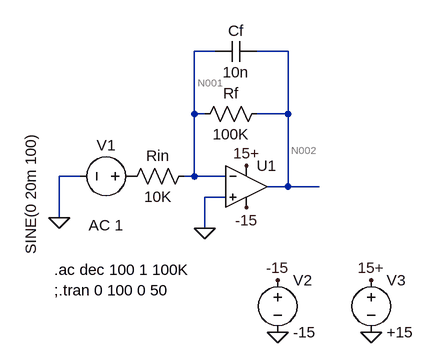
[diagram p0: schematic inverting_active_low-pass.asc]
inverting_active_low-pass.asc, the LTspice schematic file:
Version 4.1
SHEET 1 880 680
WIRE 192 16 160 16
WIRE 304 16 256 16
WIRE 160 112 160 16
WIRE 176 112 160 112
WIRE 304 112 304 16
WIRE 304 112 256 112
WIRE -16 208 -48 208
WIRE 160 208 160 112
WIRE 160 208 144 208
WIRE 208 208 160 208
WIRE 304 224 304 112
WIRE 304 224 272 224
WIRE 352 224 304 224
WIRE 208 240 176 240
WIRE -48 272 -48 208
WIRE 176 288 176 240
FLAG 176 288 0
FLAG -48 272 0
FLAG 288 448 0
FLAG 432 448 0
FLAG 432 368 15+
FLAG 288 368 -15
FLAG 240 256 -15
FLAG 240 192 15+
SYMBOL res 272 96 R90
WINDOW 0 0 56 VBottom 2
WINDOW 3 32 56 VTop 2
SYMATTR InstName Rf
SYMATTR Value 100K
SYMBOL res 160 192 R90
WINDOW 0 0 56 VBottom 2
WINDOW 3 32 56 VTop 2
SYMATTR InstName Rin
SYMATTR Value 10K
SYMBOL cap 256 0 R90
WINDOW 0 0 32 VBottom 2
WINDOW 3 32 32 VTop 2
SYMATTR InstName Cf
SYMATTR Value 10n
SYMBOL voltage 80 208 R90
WINDOW 0 -32 56 VBottom 2
WINDOW 3 27 156 Top 2
WINDOW 123 60 56 VTop 2
WINDOW 39 0 0 Left 0
SYMATTR InstName V1
SYMATTR Value SINE(0 20m 100)
SYMATTR Value2 AC 1
SYMBOL OpAmps\\UniversalOpAmp 240 224 R0
SYMATTR InstName U1
SYMBOL voltage 288 352 R0
WINDOW 123 0 0 Left 0
WINDOW 39 0 0 Left 0
SYMATTR InstName V2
SYMATTR Value -15
SYMBOL voltage 432 352 R0
WINDOW 123 0 0 Left 0
WINDOW 39 0 0 Left 0
SYMATTR InstName V3
SYMATTR Value +15
TEXT -56 352 Left 2 !.ac dec 100 1 100K\n;.tran 0 100 0 50

The netlist it stands for:
* inverting_active_low-pass.asc
Rf N002 N001 100K
Rin N001 P001 10K
Cf N002 N001 10n
V1 P001 0 SINE(0 20m 100) AC 1
X§U1 0 N001 15+ -15 N002 level1 Avol=1Meg GBW=10Meg Vos=0 En=0 Enk=0 In=0 Ink=0 Rin=500Meg  ; pins In+ In- V+ V- OUT
V2 -15 0 -15
V3 15+ 0 +15
.ac dec 100 1 100K
;.tran 0 100 0 50
.lib UniversalOpAmp1.lib
.backanno
.end

* Results of the author's LTspice run, read from the files saved beside the schematic
* Operating Point, zero values left out:
*   V(-15) = -15 V
*   V(15+) = 15 V
*   I(V2) = 30 nA
*   I(V3) = -30 nA
*   Ix(u1:3) = 30 nA
*   Ix(u1:4) = -30 nA
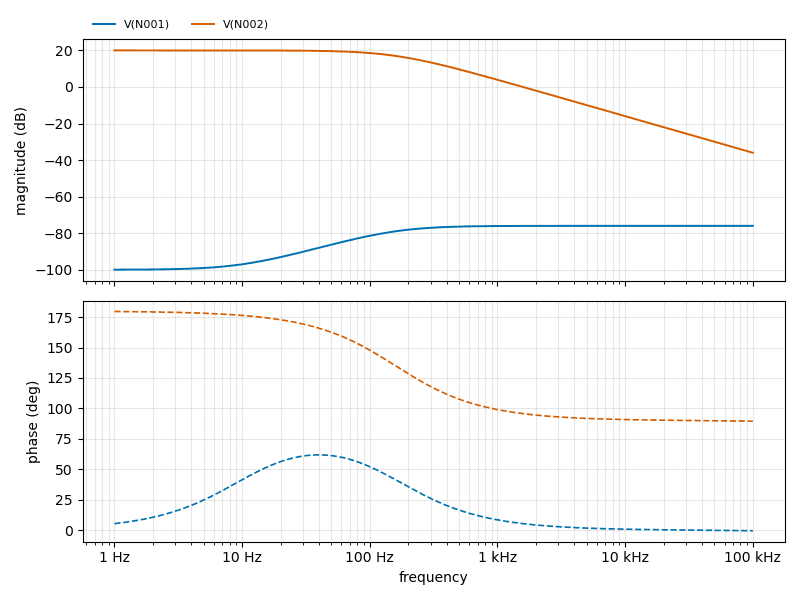
[diagram p1: AC Analysis of inverting_active_low-pass.asc, plotted from the saved traces]
* AC Analysis, 1 run:
*   V(N001): -99.96 dB at 1 Hz, -75.97 dB at 100 kHz, peak -75.97 dB at 39.81 kHz, 3 dB below the peak at 158.5 Hz
*   V(N002): 20.00 dB at 1 Hz, -35.97 dB at 100 kHz, peak 20.00 dB at 1 Hz, 3 dB below the peak at 159.1 Hz